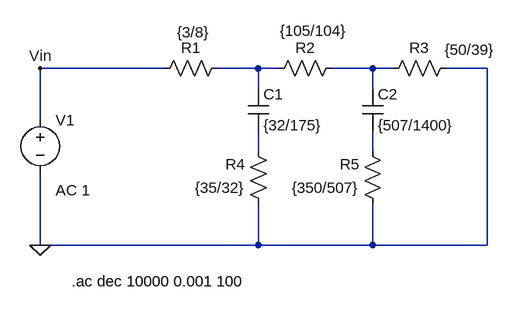
[diagram p0: schematic punto2.asc]
punto2.asc, the LTspice schematic file:
Version 4
SHEET 1 880 680
WIRE 16 128 -176 128
WIRE 160 128 96 128
WIRE 192 128 160 128
WIRE 336 128 272 128
WIRE 368 128 336 128
WIRE 512 128 448 128
WIRE 160 160 160 128
WIRE 336 160 336 128
WIRE -176 208 -176 128
WIRE 160 256 160 224
WIRE 336 256 336 224
WIRE -176 400 -176 288
WIRE 160 400 160 336
WIRE 160 400 -176 400
WIRE 336 400 336 336
WIRE 336 400 160 400
WIRE 512 400 512 128
WIRE 512 400 336 400
FLAG -176 400 0
FLAG -176 128 Vin
SYMBOL res 112 112 R90
WINDOW 0 0 56 VBottom 2
WINDOW 3 -55 52 VTop 2
SYMATTR InstName R1
SYMATTR Value {3/8}
SYMBOL res 288 112 R90
WINDOW 0 0 56 VBottom 2
WINDOW 3 -57 43 VTop 2
SYMATTR InstName R2
SYMATTR Value {105/104}
SYMBOL res 464 112 R90
WINDOW 0 0 56 VBottom 2
WINDOW 3 -28 -22 VTop 2
SYMATTR InstName R3
SYMATTR Value {50/39}
SYMBOL res 176 352 R180
WINDOW 0 36 76 Left 2
WINDOW 3 36 40 Left 2
SYMATTR InstName R4
SYMATTR Value {35/32}
SYMBOL res 352 352 R180
WINDOW 0 36 76 Left 2
WINDOW 3 36 40 Left 2
SYMATTR InstName R5
SYMATTR Value {350/507}
SYMBOL cap 144 160 R0
SYMATTR InstName C1
SYMATTR Value {32/175}
SYMBOL cap 320 160 R0
SYMATTR InstName C2
SYMATTR Value {507/1400}
SYMBOL voltage -176 192 R0
WINDOW 123 24 124 Left 2
WINDOW 39 0 0 Left 0
SYMATTR InstName V1
SYMATTR Value ""
SYMATTR Value2 AC 1
TEXT -128 456 Left 2 !.ac dec 10000 0.001 100

The netlist it stands for:
* punto2.asc
R1 N001 Vin {3/8}
R2 N002 N001 {105/104}
R3 0 N002 {50/39}
R4 0 N003 {35/32}
R5 0 N004 {350/507}
C1 N001 N003 {32/175}
C2 N002 N004 {507/1400}
V1 Vin 0 AC 1
.ac dec 10000 0.001 100
.backanno
.end